# EAGLE schematic VU Meter and Summing amp - rev 1 (EAGLE 7.5.0)
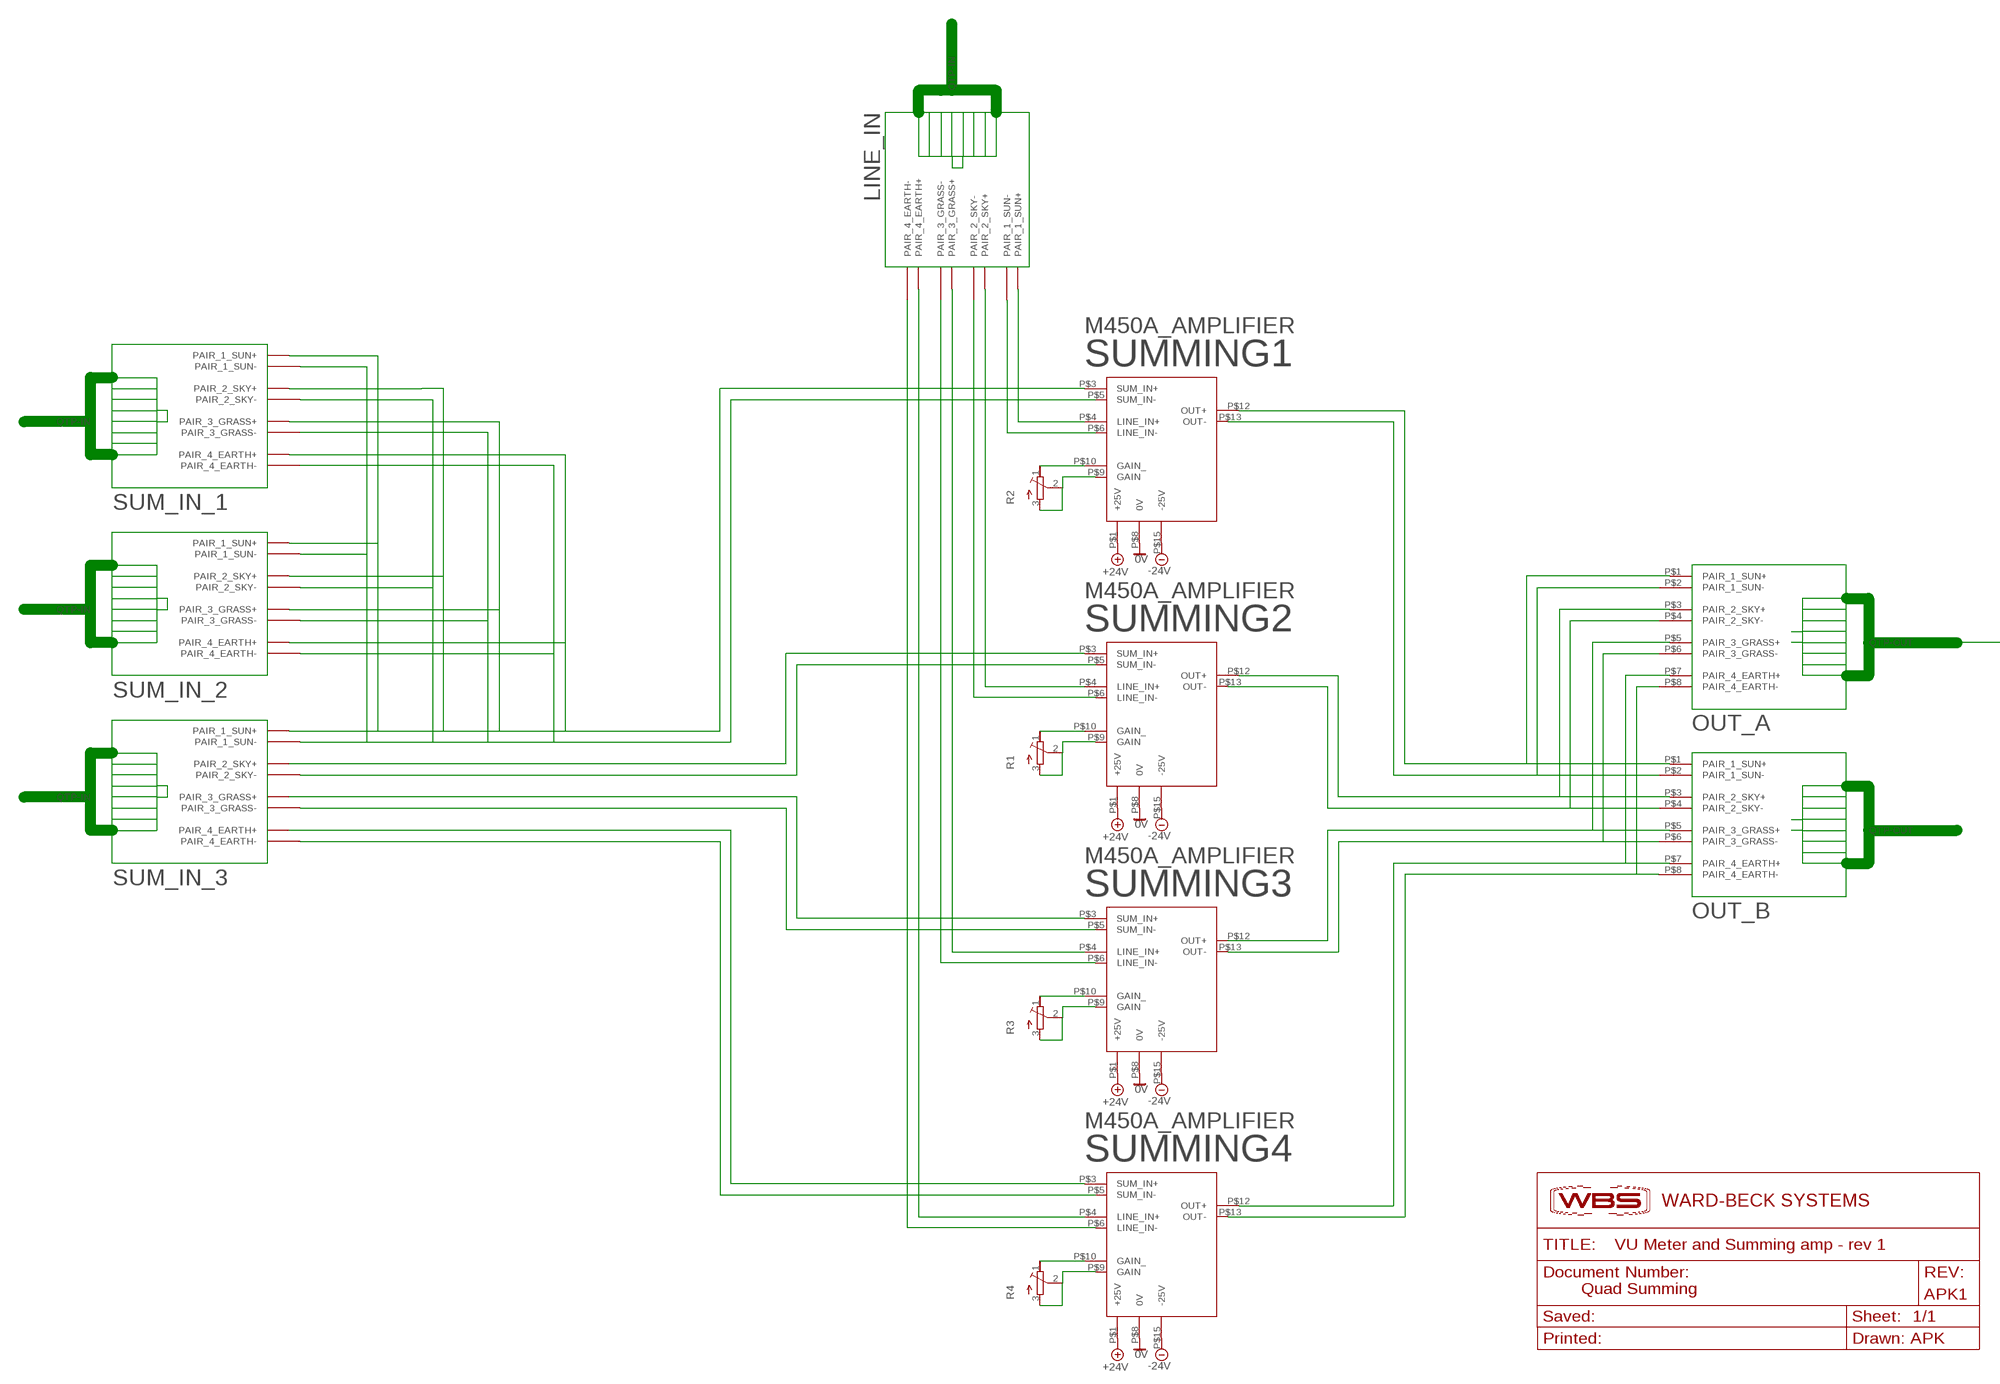
[diagram p0: schematic, sheet 1, part 1 of 2]
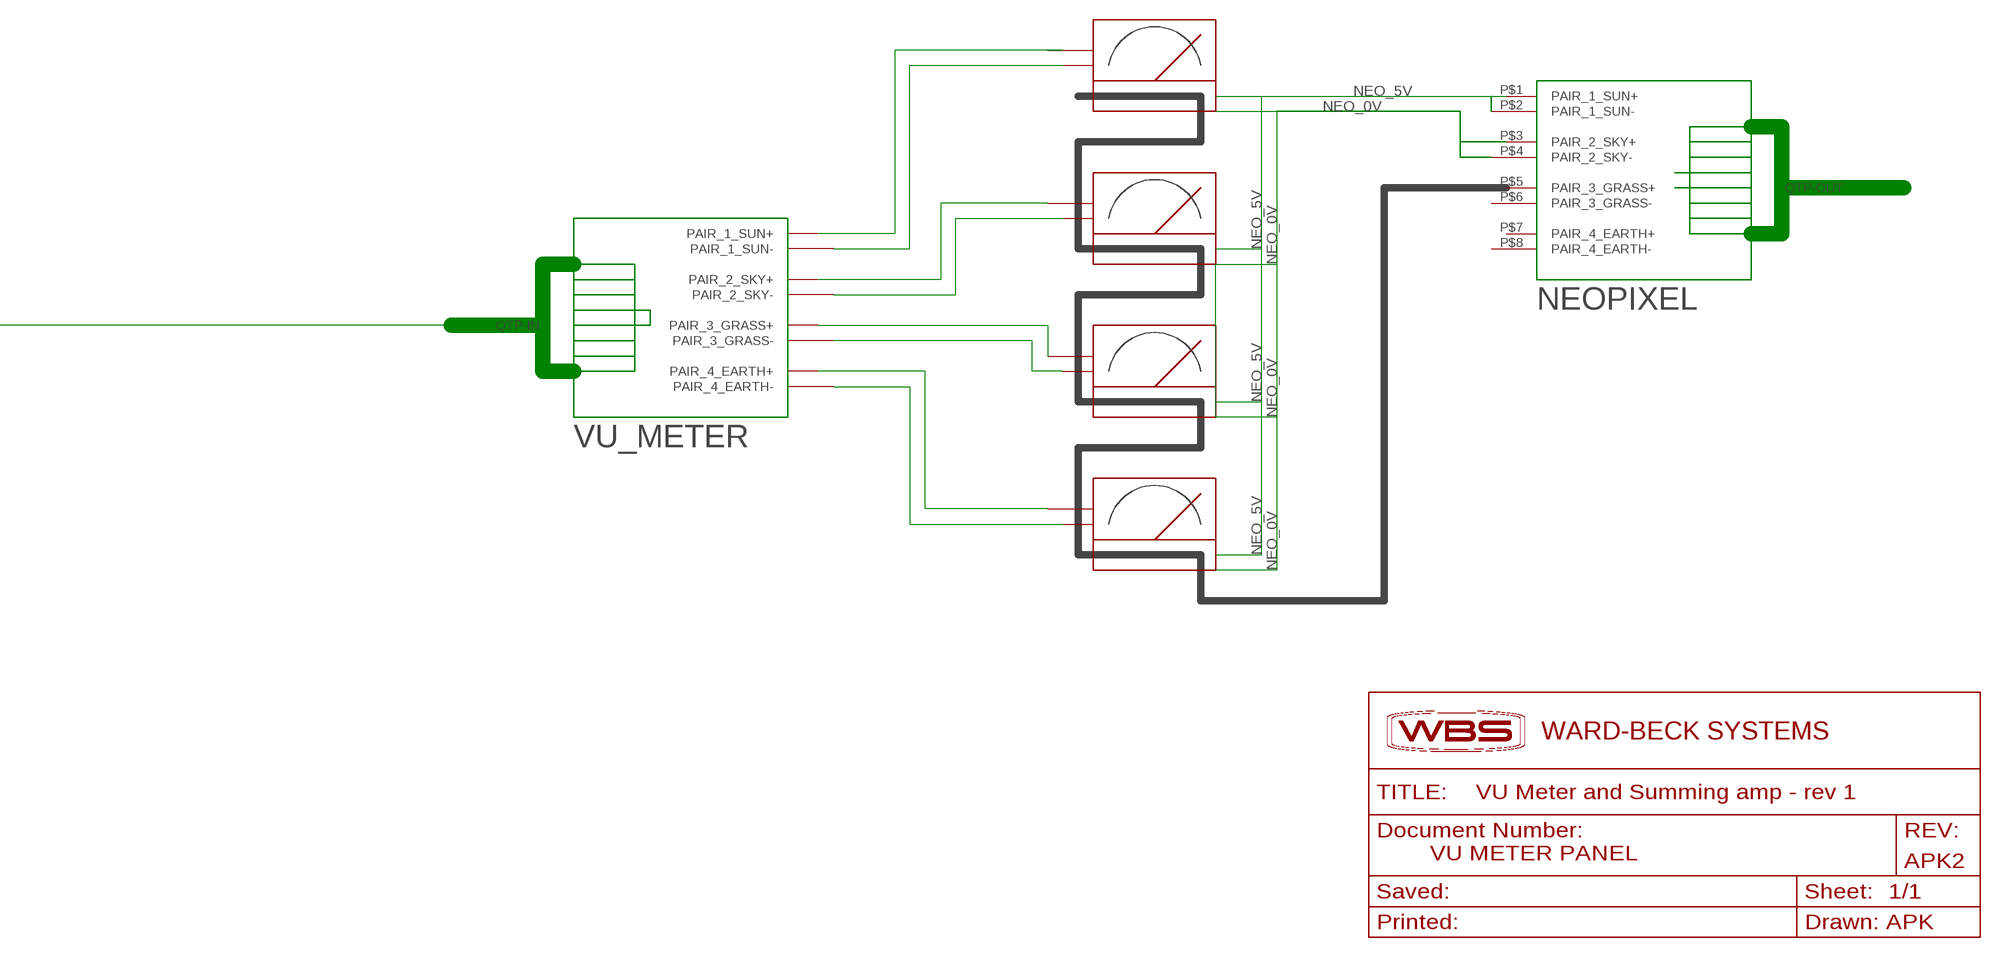
[diagram p1: schematic, sheet 1, part 2 of 2]

## Parts
APK1  Quad Summing  WBS-DOCUMENT_INFO_FRAME  [WBS-FRAME_PCB]
APK2  VU METER PANEL  WBS-DOCUMENT_INFO_FRAME  [WBS-FRAME_PCB]
LINE_IN  QTP-OUT  [PLACEHOLDER]
NEOPIXEL  QTP-IN  [PLACEHOLDER]
OUT_A  QTP-IN  [PLACEHOLDER]
OUT_B  QTP-IN  [PLACEHOLDER]
R1  R-TRIMM43P  [RTRIM43P]
R2  R-TRIMM43P  [RTRIM43P]
R3  R-TRIMM43P  [RTRIM43P]
R4  R-TRIMM43P  [RTRIM43P]
SUM_IN_1  QTP-OUT  [PLACEHOLDER]
SUM_IN_2  QTP-OUT  [PLACEHOLDER]
SUM_IN_3  QTP-OUT  [PLACEHOLDER]
SUMMING1  M450A_AMPLIFIER  [M450A_AMPLIFIER]
SUMMING2  M450A_AMPLIFIER  [M450A_AMPLIFIER]
SUMMING3  M450A_AMPLIFIER  [M450A_AMPLIFIER]
SUMMING4  M450A_AMPLIFIER  [M450A_AMPLIFIER]
U$1  VU_METER  [VU_METER]
U$2  VU_METER  [VU_METER]
U$3  VU_METER  [VU_METER]
U$4  VU_METER  [VU_METER]
VU_METER  QTP-OUT  [PLACEHOLDER]

## Nets
0V: SUMMING1.P$8(0V) SUMMING2.P$8(0V) SUMMING3.P$8(0V) SUMMING4.P$8(0V)
+24V: SUMMING1.P$1(+25V) SUMMING2.P$1(+25V) SUMMING3.P$1(+25V) SUMMING4.P$1(+25V)
-24V: SUMMING1.P$15(-25V) SUMMING2.P$15(-25V) SUMMING3.P$15(-25V) SUMMING4.P$15(-25V)
N$1: SUM_IN_1.P$1(PAIR_1_SUN+) SUM_IN_1.P$5(PAIR_3_GRASS+) SUM_IN_1.P$7(PAIR_4_EARTH+) SUM_IN_2.P$1(PAIR_1_SUN+) SUM_IN_2.P$3(PAIR_2_SKY+) SUM_IN_2.P$5(PAIR_3_GRASS+) SUM_IN_2.P$7(PAIR_4_EARTH+) SUM_IN_3.P$1(PAIR_1_SUN+) SUMMING1.P$3(SUM_IN+)
N$2: SUM_IN_1.P$3(PAIR_2_SKY+)
N$3: SUM_IN_3.P$5(PAIR_3_GRASS+) SUMMING3.P$3(SUM_IN+)
N$4: SUM_IN_3.P$7(PAIR_4_EARTH+) SUMMING4.P$3(SUM_IN+)
N$5: SUM_IN_3.P$8(PAIR_4_EARTH-) SUMMING4.P$5(SUM_IN-)
N$6: SUM_IN_3.P$6(PAIR_3_GRASS-) SUMMING3.P$5(SUM_IN-)
N$7: SUM_IN_3.P$4(PAIR_2_SKY-) SUMMING2.P$5(SUM_IN-)
N$8: SUM_IN_1.P$2(PAIR_1_SUN-) SUM_IN_1.P$6(PAIR_3_GRASS-) SUM_IN_1.P$8(PAIR_4_EARTH-) SUM_IN_2.P$2(PAIR_1_SUN-) SUM_IN_2.P$6(PAIR_3_GRASS-) SUM_IN_2.P$8(PAIR_4_EARTH-) SUM_IN_3.P$2(PAIR_1_SUN-) SUMMING1.P$5(SUM_IN-)
N$9: LINE_IN.P$1(PAIR_1_SUN+) SUMMING1.P$4(LINE_IN+)
N$10: LINE_IN.P$2(PAIR_1_SUN-) SUMMING1.P$6(LINE_IN-)
N$11: LINE_IN.P$3(PAIR_2_SKY+) SUMMING2.P$4(LINE_IN+)
N$12: LINE_IN.P$4(PAIR_2_SKY-) SUMMING2.P$6(LINE_IN-)
N$13: LINE_IN.P$5(PAIR_3_GRASS+) SUMMING3.P$4(LINE_IN+)
N$14: LINE_IN.P$6(PAIR_3_GRASS-) SUMMING3.P$6(LINE_IN-)
N$15: LINE_IN.P$7(PAIR_4_EARTH+) SUMMING4.P$4(LINE_IN+)
N$16: LINE_IN.P$8(PAIR_4_EARTH-) SUMMING4.P$6(LINE_IN-)
N$17: SUM_IN_3.P$3(PAIR_2_SKY+) SUMMING2.P$3(SUM_IN+)
N$18: SUM_IN_1.P$4(PAIR_2_SKY-) SUM_IN_2.P$4(PAIR_2_SKY-)
N$19: OUT_A.P$8(PAIR_4_EARTH-) OUT_B.P$8(PAIR_4_EARTH-) SUMMING4.P$13(OUT-)
N$20: OUT_A.P$4(PAIR_2_SKY-) OUT_B.P$4(PAIR_2_SKY-) SUMMING2.P$13(OUT-)
N$21: OUT_A.P$2(PAIR_1_SUN-) OUT_B.P$2(PAIR_1_SUN-) SUMMING1.P$13(OUT-)
N$22: OUT_A.P$1(PAIR_1_SUN+) OUT_B.P$1(PAIR_1_SUN+) SUMMING1.P$12(OUT+)
N$23: OUT_A.P$3(PAIR_2_SKY+) OUT_B.P$3(PAIR_2_SKY+) SUMMING2.P$12(OUT+)
N$24: OUT_A.P$5(PAIR_3_GRASS+) OUT_B.P$5(PAIR_3_GRASS+)
N$25: OUT_A.P$7(PAIR_4_EARTH+) OUT_B.P$7(PAIR_4_EARTH+) SUMMING4.P$12(OUT+)
N$26: OUT_A.P$6(PAIR_3_GRASS-) OUT_B.P$6(PAIR_3_GRASS-) SUMMING3.P$13(OUT-)
N$27: R1.1(E) SUMMING2.P$10(GAIN_)
N$28: R1.2(S) R1.3(A) SUMMING2.P$9(GAIN)
N$29: R2.1(E) SUMMING1.P$10(GAIN_)
N$30: R2.2(S) R2.3(A) SUMMING1.P$9(GAIN)
N$31: R3.1(E)
N$32: R3.2(S) R3.3(A)
N$33: R4.1(E) SUMMING4.P$10(GAIN_)
N$34: R4.2(S) R4.3(A) SUMMING4.P$9(GAIN)
N$35: OUT_A.P$9(QTP-OUT) VU_METER.P$9(QTP-IN)
N$36: VU_METER.P$1(PAIR_1_SUN+)
N$37: U$1.P$1 VU_METER.P$2(PAIR_1_SUN-)
N$38: U$2.P$2 VU_METER.P$3(PAIR_2_SKY+)
N$39: U$2.P$1 VU_METER.P$4(PAIR_2_SKY-)
N$40: U$4.P$1 VU_METER.P$8(PAIR_4_EARTH-)
N$41: U$4.P$2 VU_METER.P$7(PAIR_4_EARTH+)
N$42: U$3.P$2 VU_METER.P$5(PAIR_3_GRASS+)
N$43: U$3.P$1 VU_METER.P$6(PAIR_3_GRASS-)
NEO_0V: NEOPIXEL.P$3(PAIR_2_SKY+) NEOPIXEL.P$4(PAIR_2_SKY-)
NEO_5V: NEOPIXEL.P$1(PAIR_1_SUN+) NEOPIXEL.P$2(PAIR_1_SUN-)
Unconnected: LINE_IN.P$9(QTP-IN) NEOPIXEL.P$5(PAIR_3_GRASS+) NEOPIXEL.P$6(PAIR_3_GRASS-) NEOPIXEL.P$7(PAIR_4_EARTH+) NEOPIXEL.P$8(PAIR_4_EARTH-) NEOPIXEL.P$9(QTP-OUT) OUT_B.P$9(QTP-OUT) SUM_IN_1.P$9(QTP-IN) SUM_IN_2.P$9(QTP-IN) SUM_IN_3.P$9(QTP-IN) SUMMING3.P$9(GAIN) SUMMING3.P$10(GAIN_) SUMMING3.P$12(OUT+) U$1.P$2

## Library data of the parts
APK1 APK2 = APK - PARTS:WBS-DOCUMENT_INFO_FRAME
LINE_IN SUM_IN_1-SUM_IN_3 VU_METER = Ward-Beck Systems - 2015:QTP-OUT
NEOPIXEL OUT_A OUT_B = Ward-Beck Systems - 2015:QTP-IN
R1-R4 = resistor:R-TRIMM: Trimm resistor
SUMMING1-SUMMING4 = Ward-Beck Systems - 2015:M450A_AMPLIFIER
U$1-U$4 = TONY_WBS:VU_METER